# EasyEDA Pro project board.epro, board 黄山派LCD屏幕板_PCB_V110
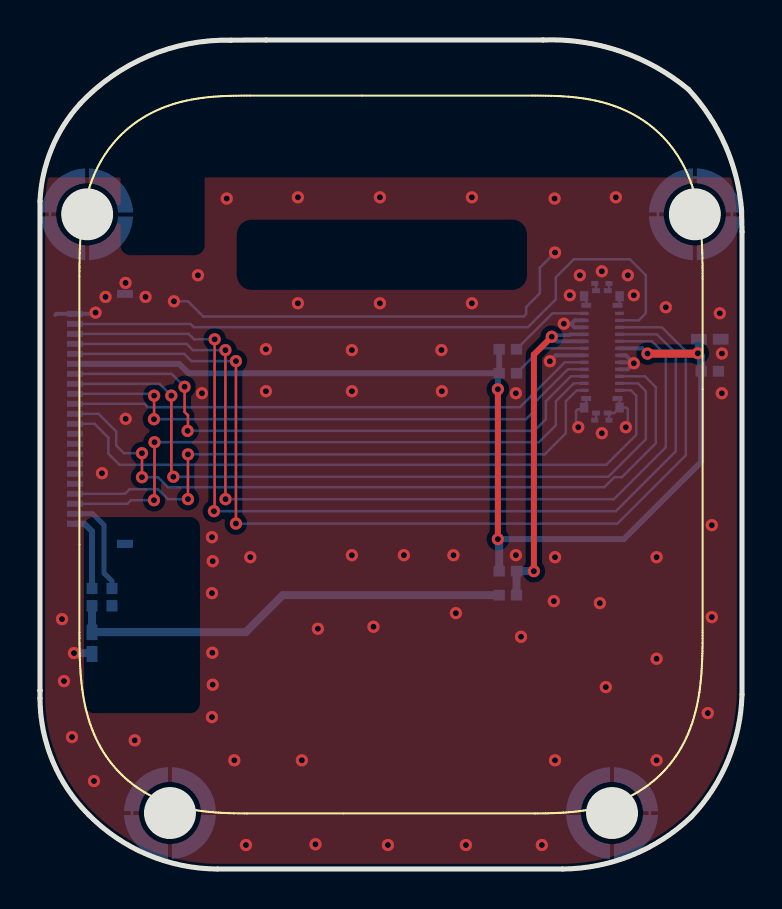
[diagram p9: board, top side]
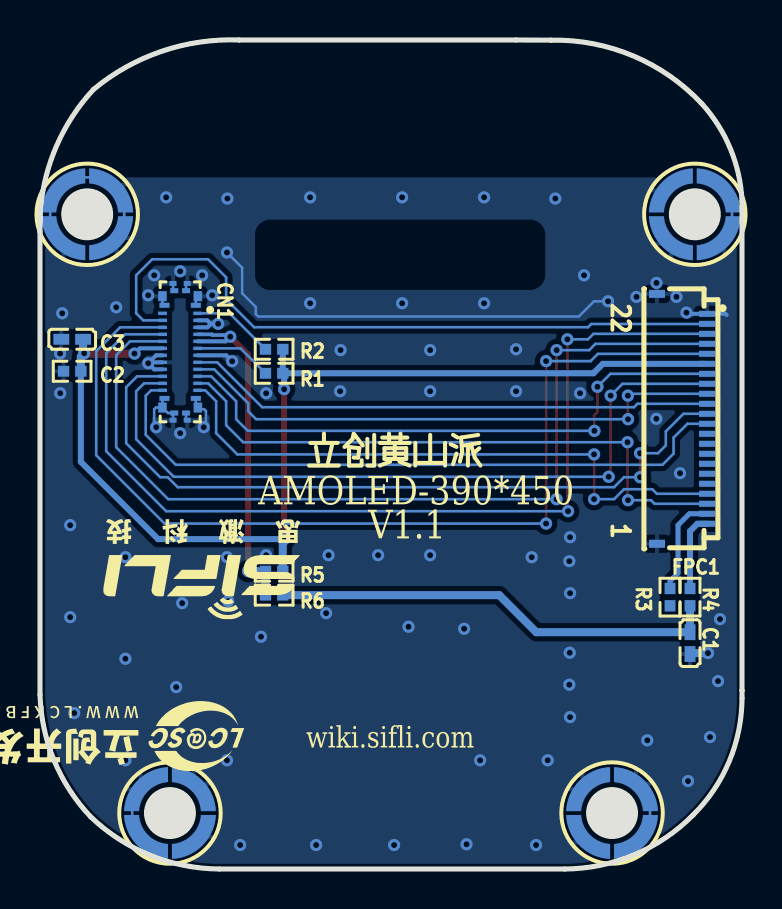
[diagram p10: board, bottom side, seen from below]

Outline 35.11 x 41.47 mm; copper layers: Top Layer, Bottom Layer. Coordinates in mm from the lower left corner of the outline.
Outline path: 0,33.4 0,8.93 arc(0,8.93) 0,8.93 0,8.54 arc(0.64,5.38) 2.45,2.7 arc(5.39,0.71) 8.87,0 26.13,0 arc(29.6,0.69) 32.57,2.61 arc(34.41,5.44) 35.11,8.73 35.11,31.88 35.09,32.94 arc(34.27,36.2) 32.43,39 arc(29.02,40.91) 25.15,41.47 11.3,41.47 9.53,41.46 arc(5.43,40.67) 2.01,38.28 arc(0.58,36.02) 0,33.4
Stack: Top Layer 0.035mm / Dielectric1 0.91mm FR4 er 4.5 / Bottom Layer 0.035mm

## Design rules (mm)
template: 自定义配置
spacing copperThickness1oz (default): track to track 0.102, other pairs 0.152 to 0.3
spacing copperThickness2oz: track to track 0.203, other pairs 0.152 to 0.3
spacing safeClearance1: track to track 0.152, other pairs 0 to 0.3
track width copperThickness1oz (default): min 0.127, default 0.127, max 2.54
track width copperThickness2oz: min 0.203, default 0.254, max 2.54
differential pair differentialPair (default): width min 0.127, default 0.254, max 2.54; gap min 0.152, default 0.152
via viaSize (default): diameter min 0.5, default 0.61, max 10; hole min 0.3, default 0.305, max 6.3
region e8 uses safeClearance1
region e62 uses safeClearance1
region e75 uses safeClearance1
region e78 uses safeClearance1

## Placement (name value [footprint] x y rotation side)
C1  4.7uF  [C0402]  2.6 11.3 270 bottom
C2  100nF  [R0402]  33.5 24.9 180 bottom
C3  4.7uF  [C0402]  33.5 26.5 180 bottom
CN1  OK-118-RF024/2-35  [CONN-SMD_24P-P0.35_OK-118-RF024-2-35]  28.1 25.87 270 bottom
FPC1  AFH34-S22FIA-1H  [FPC-SMD_22P-P0.50_JS_AFH34-S22FIA-1H]  3 22.52 270 bottom
M1  SMTWE2055MTJ  [SMD_BD4.4-L4.4-D2.8]  28.61 2.8 180 bottom
M2  SMTWE2055MTJ  [SMD_BD4.4-L4.4-D2.8]  2.36 32.75 180 bottom
M3  SMTWE2055MTJ  [SMD_BD4.4-L4.4-D2.8]  6.5 2.8 180 bottom
M4  SMTWE2055MTJ  [SMD_BD4.4-L4.4-D2.8]  32.75 32.75 180 bottom
R1  1MΩ  [R0402]  23.4 24.8 0 bottom
R2  10kΩ  [R0402]  23.4 26 0 bottom
R3  0Ω  [R0402]  3.6 13.6 90 bottom
R4  0Ω  [R0402]  2.6 13.6 90 bottom
R5  0Ω  [R0402]  23.4 14.9 0 bottom
R6  0Ω  [R0402]  23.4 13.7 0 bottom

## Footprints (pads in the part's own frame, mm; a bottom-side part is the same pattern mirrored in y, then rotated)
C0402
  rect 0.79x0.54 smd: 1(-0.545,0) 2(0.545,0)
CONN-SMD_24P-P0.35_OK-118-RF024-2-35
  rect 0.17x0.44 smd: 1(-1.925,0.88) 2(-1.575,0.88) 3(-1.225,0.88) 4(-0.875,0.88) 5(-0.525,0.88) 6(-0.175,0.88) 7(0.175,0.88) 8(0.525,0.88) 9(0.875,0.88) 10(1.225,0.88) 11(1.575,0.88) 12(1.925,0.88) 13(1.925,-0.88) 14(1.575,-0.88) 15(1.225,-0.88) 16(0.875,-0.88) 17(0.525,-0.88) 18(0.175,-0.88) 19(-0.175,-0.88) 20(-0.525,-0.88) 21(-0.875,-0.88) 22(-1.225,-0.88) 23(-1.575,-0.88) 24(-1.925,-0.88)
  rect 0.25x0.5 smd: 25(2.33,0.785) 26(2.33,-0.785) 33(-2.33,0.785) 34(-2.33,-0.785)
  rect 0.5x0.425 smd: 27(2.785,0.887) 28(2.785,-0.887) 35(-2.785,0.887) 36(-2.785,-0.887)
  rect 0.25x0.4 smd: 29(3.06,0.295) 30(3.06,-0.295) 37(-3.06,0.295) 38(-3.06,-0.295)
  rect 0.25x0.35 smd: 31(3.42,0.355) 32(3.42,-0.355) 39(-3.42,0.355) 40(-3.42,-0.355)
FPC-SMD_22P-P0.50_JS_AFH34-S22FIA-1H
  rect 0.3x0.8 smd: 1(-5.25,1.25) 2(-4.75,1.25) 3(-4.25,1.25) 4(-3.75,1.25) 5(-3.25,1.25) 6(-2.75,1.25) 7(-2.25,1.25) 8(-1.75,1.25) 9(-1.25,1.25) 10(-0.75,1.25) 11(-0.25,1.25) 12(0.25,1.25) 13(0.75,1.25) 14(1.25,1.25) 15(1.75,1.25) 16(2.25,1.25) 17(2.75,1.25) 18(3.25,1.25) 19(3.75,1.25) 20(4.25,1.25) 21(4.75,1.25) 22(5.25,1.25)
  rect 0.4x0.8 smd: 23(6.25,-1.25) 24(-6.25,-1.25)
R0402
  rect 0.566x0.54 smd: 1(-0.433,0) 2(0.433,0)
SMD_BD4.4-L4.4-D2.8
  custom 2.2x2.2 smd: 1(-1.474,1.196) 1(-1.196,-1.474) 1(1.196,1.474) 1(1.474,-1.196)

## Nets
As in the schematic.

Pads without a net: CN1 24; FPC1 13 14 15 16 17 18

## Via types
v1: diameter 0.61, hole 0.305, Top Layer to Bottom Layer, 104 vias

## Routing (per net, layer and track width the routed paths; a pad name or vN(x,y) marks a point on that pad's centre or on a via; arc(x,y) is an arc through that point)
GND: length 56.3
  Bottom Layer w0.127: v1(26.92,22.1) 26.81,22.21 26.81,22.91 26.9,23 27.13,23 27.21,23.08 27.32,23.19 CN1.25 ; M3.1 4.6,3.57 4.6,2.03 M3.1 ; CN1.31 27.81,22.51 CN1.29 ; M1.1 30.5,2.02 30.5,3.58 M1.1 ; 28.99,23.08 28.99,23.44 CN1.26 ; 28.99,23.08 28.71,22.81 28.4,22.81 28.46,22.75 CN1.32 ; 28.99,23.08 29.32,23.08 29.4,23 29.4,22.2 v1(29.3,22.1) ; v1(25.76,30.84) 25,30.08 25,28.8 24.32,28.12 24.32,27.76 24.19,27.64 8.16,27.64 7.4,28.4 v1(6.7,28.4) ; M4.1 30.9,31.93 30.9,33.57 M4.1 31.93,34.6 33.57,34.6 M4.1 34.6,33.57 34.6,31.93 M4.1 ; CN1.34 28.99,28.3 CN1.36 ; CN1.33 27.32,28.55 CN1.35 ; CN1.40 28.46,28.99 28.4,28.93 ; CN1.39 27.81,29.23 CN1.37 ; M2.1 0.5,31.94 0.5,33.56 M2.1
  Bottom Layer w0.2: CN1.7 25.8,25.69 v1(25.5,25.4) ; 26.56,27.26 26.75,27.44 27.22,27.44 ; 26.56,27.26 26.55,27.27 v1(26.2,27.27) ; 26.56,27.26 26.73,27.09 CN1.3 ; CN1.17 29.66,25.34 29.31,25.69 CN1.18 ; v1(29.7,25.3) 29.4,25 CN1.16 ; 0.77,27.71 0.83,27.77 2.68,27.77 2.74,27.83 v1(2.78,27.83)
  Bottom Layer w0.4: C1.2 2.56,10.8 v1(1.7,10.8)
  vias: v1(1.1,12.5) v1(1.2,9.4) v1(1.6,6.6) v1(2.7,4.4) v1(3.1,19.8) v1(3.28,28.62) v1(4.28,29.32) v1(4.29,22.52) v1(4.74,6.44) v1(5.28,28.62) v1(7.9,29.7) v1(8.1,23.8) v1(8.6,16.6) v1(8.64,15.4) v1(8.6,13.8) v1(8.62,10.82) v1(8.64,9.22) v1(8.6,7.6) v1(9.34,33.54) v1(9.72,5.44) v1(10.3,1.2) v1(10.52,15.6) v1(11.3,26) v1(11.3,23.9) v1(12.9,33.6) v1(12.9,28.3) v1(13.1,5.44) v1(13.78,1.24) v1(13.9,12.02) v1(15.6,25.96) v1(15.6,23.9) v1(15.6,15.7) v1(16.68,12.12) v1(17,33.6) v1(17,28.3) v1(17.4,1.2) v1(18.2,15.7) v1(20.08,25.96) v1(20.1,23.9) v1(20.68,15.7) v1(20.8,12.8) v1(21.3,1.2) v1(21.6,33.6) v1(21.6,28.3) v1(23.8,23.8) v1(23.8,15.7) v1(24.06,11.62) v1(25.1,1.2) v1(25.74,33.54) v1(25.7,13.4) v1(25.76,15.6) v1(25.76,5.44) v1(26.5,28.7) v1(27,29.7) v1(28,13.3) v1(28.1,29.9) v1(28.1,21.8) v1(28.3,9.1) v1(28.8,33.6) v1(29.4,29.7) v1(29.7,28.7) v1(30.84,15.6) v1(30.84,10.52) v1(30.84,5.44) v1(31.3,28.1) v1(33.4,7.8) v1(33.6,17.2) v1(33.6,12.6) v1(34,27.8) v1(34.11,25.79) v1(34.1,23.8)
VBAT: length 22.5
  Bottom Layer w0.4: R6.1 12.14,13.7 10.29,11.84 C1.1 2.6,13.17
VCC_3V3: length 54.8
  Top Layer w0.3: v1(22.9,16.5) v1(22.9,24)
  Top Layer w0.4: v1(30.38,25.78) 32.88,25.78 v1(32.9,25.8)
  Bottom Layer w0.127: 1.56,25.26 1.57,25.27 1.87,25.27
  Bottom Layer w0.2: v1(30.38,25.78) 30.12,26.05 CN1.19
  Bottom Layer w0.3: v1(22.9,24) 22.9,24.73 R1.1 ; C2.2 33.07,20.37 29.2,16.5 v1(22.9,16.5) ; R1.1 7.43,24.8 6.96,25.27 1.87,25.27 ; R1.1 R2.1
  Bottom Layer w0.4: R5.1 22.97,16.43 v1(22.9,16.5) ; C3.2 32.96,25.86 v1(32.9,25.8) 33.07,25.63 C2.2
PA_00_LCD_QSPI_RSTB: length 37.4
  Top Layer w0.127: v1(5.1,20.8) v1(5.1,19.6)
  Bottom Layer w0.127: FPC1.11 2.93,22.77 3.81,21.89 3.81,21.19 4.2,20.8 v1(5.1,20.8) ; 28.98,24.64 30.26,24.64 30.8,24.1 30.8,21.3 29.1,19.6 28.72,19.6 28.22,19.1 6.4,19.1 5.9,19.6 v1(5.1,19.6)
PA_02_LCD_QSPI_TE: length 32.9
  Bottom Layer w0.127: 28.98,23.94 29.56,23.94 29.82,23.68 29.82,21.72 28.32,20.22 3.98,20.22 3.42,20.78 3.42,21.58 2.73,22.27 FPC1.12
PA_03_LCD_QSPI_CS: length 37.5
  Top Layer w0.127: v1(6.67,19.62) 6.57,19.72 v1(6.57,23.68)
  Bottom Layer w0.127: v1(6.67,19.62) 28.42,19.62 30.3,21.5 30.3,23.9 29.91,24.3 CN1.14 ; v1(6.57,23.68) 5.98,24.27 FPC1.8
PA_04_LCD_QSPI_CLK: length 26.5
  Bottom Layer w0.127: CN1.8 26.25,25.34 24,23.1 5.4,23.1 5.23,23.27 FPC1.10
PA_05_LCD_QSPI_D0: length 28
  Top Layer w0.127: v1(5.7,22.5) 5.71,22.51 v1(5.71,23.68)
  Bottom Layer w0.127: CN1.9 26.4,25 24.7,23.3 24.7,22.9 24.3,22.5 v1(5.7,22.5) ; FPC1.9 5.62,23.77 v1(5.71,23.68)
PA_06_LCD_QSPI_D1: length 29.5
  Top Layer w0.127: v1(7.23,24.12) 7.23,22.87 7.4,22.7 7.4,21.94 v1(7.38,21.92)
  Bottom Layer w0.127: FPC1.7 6.58,24.77 v1(7.23,24.12) ; v1(7.38,21.92) 24.72,21.92 25.3,22.5 25.3,23.4 26.55,24.64 27.22,24.64
PA_07_LCD_QSPI_D2: length 30.4
  Top Layer w0.127: v1(5.7,18.45) 5.73,18.48 v1(5.73,21.35)
  Bottom Layer w0.127: v1(5.7,18.45) 4.55,18.45 4.37,18.27 FPC1.20 ; v1(5.73,21.35) 24.95,21.35 25.8,22.2 25.8,23.4 26.7,24.3 CN1.11
PA_08_LCD_QSPI_D3: length 30.3
  Top Layer w0.127: v1(7.4,18.5) v1(7.4,20.74)
  Bottom Layer w0.127: FPC1.19 4.26,18.77 4.49,19 5.9,19 6.4,18.5 v1(7.4,18.5) ; v1(7.4,20.74) 25.24,20.74 26.3,21.8 26.3,23.4 26.85,23.94 27.22,23.94
PA_09_TP_RSTN: length 34.4
  Bottom Layer w0.127: 28.98,27.44 29.95,27.44 30.3,27.8 30.3,29.7 29.5,30.5 26.7,30.5 25.8,29.6 25.8,28.5 24.4,27.1 7.7,27.1 7.54,27.26 1.76,27.26 FPC1.2
PA_33_TP_SDA: length 45.4
  Top Layer w0.127: v1(9.28,18.5) 9.27,18.51 v1(9.27,25.96)
  Bottom Layer w0.127: v1(9.28,18.5) 28.7,18.5 31.3,21.1 31.3,25.7 30.61,26.39 CN1.20 ; v1(9.27,25.96) 7.64,25.96 7.33,26.27 FPC1.4
PA_37_TP_SCL: length 48.2
  Top Layer w0.127: v1(8.7,17.9) 8.74,17.94 v1(8.74,26.5)
  Bottom Layer w0.127: v1(8.7,17.9) 28.8,17.9 31.8,20.9 31.8,25.8 30.86,26.75 CN1.21 ; v1(8.74,26.5) 7.7,26.5 7.43,26.77 FPC1.3
PA_41_TP_INT: length 49.3
  Top Layer w0.127: v1(9.8,17.28) v1(9.8,25.41)
  Bottom Layer w0.127: v1(9.8,25.41) 7.57,25.41 7.21,25.77 FPC1.5 ; v1(9.8,17.28) 28.88,17.28 32.3,20.7 32.3,25.9 31.11,27.09 CN1.22
$1N6115: length 4.1
  Bottom Layer w0.127: R2.2 25.63,27.8 CN1.1
$1N6940: length 3.9
  Bottom Layer w0.127: CN1.6 25.08,26.05 R1.2
$1N7967: length 5
  Bottom Layer w0.25: R3.2 3.6,14.4 3.2,14.8 3.2,17.2 2.63,17.77 FPC1.21
$1N8012: length 3.9
  Bottom Layer w0.3: R4.2 2.6,16.9 2.23,17.27 FPC1.22
$1N8098: length 17.4
  Top Layer w0.3: v1(24.7,14.9) 24.7,25.73 v1(25.6,26.63)
  Bottom Layer w0.18: 25.75,26.47 25.75,26.71 26.47,26.71 26.51,26.75 CN1.4
  Bottom Layer w0.2: 25.75,26.47 25.83,26.39 CN1.5
  Bottom Layer w0.4: R6.2 R5.2 v1(24.7,14.9)

## Copper pours and planes (outline as drawn; the poured copper is in the pictures)
GND on Top Layer: -0.03,43.44 37.41,43.44 37.41,-0.02 -0.03,-0.02
GND on Bottom Layer: -0.03,43.44 37.41,43.44 37.41,-0.02 -0.03,-0.02

## Text on the board
Bottom Silkscreen Layer: 22 | 1 | V1.1 | 立创黄山派 | AMOLED-390*450 | wiki.sifli.com
Mechanical Layer: A1D85009-V1 CYYWW
Ratline Layer: 12 | 10 | 11 | 13 | 14 | 15 | 4 | 7 | 3 | 8 | 5 | 2 | 9 | 6 | 1 | 17 | 16 | 20 | 24 | 18 | 21 | 22 | 23 | 19 | A1D85009-V1 CYYWW | 弯折区 / 单层区
Drill Drawing Layer: Mark | Count | 100 | Size | 12.0mil(0.305mm) | Plated | PTH | Shape | Round | Via/Pad | Via | Pad Shape | Layer Pair | Top Layer-Bottom Layer | 板厚： 1.0mm
